# Altium schematic sheet Terminal-Sheet.SchDoc
size 420 x 297 mm; SheetNumber: 5; SheetTotal: 8
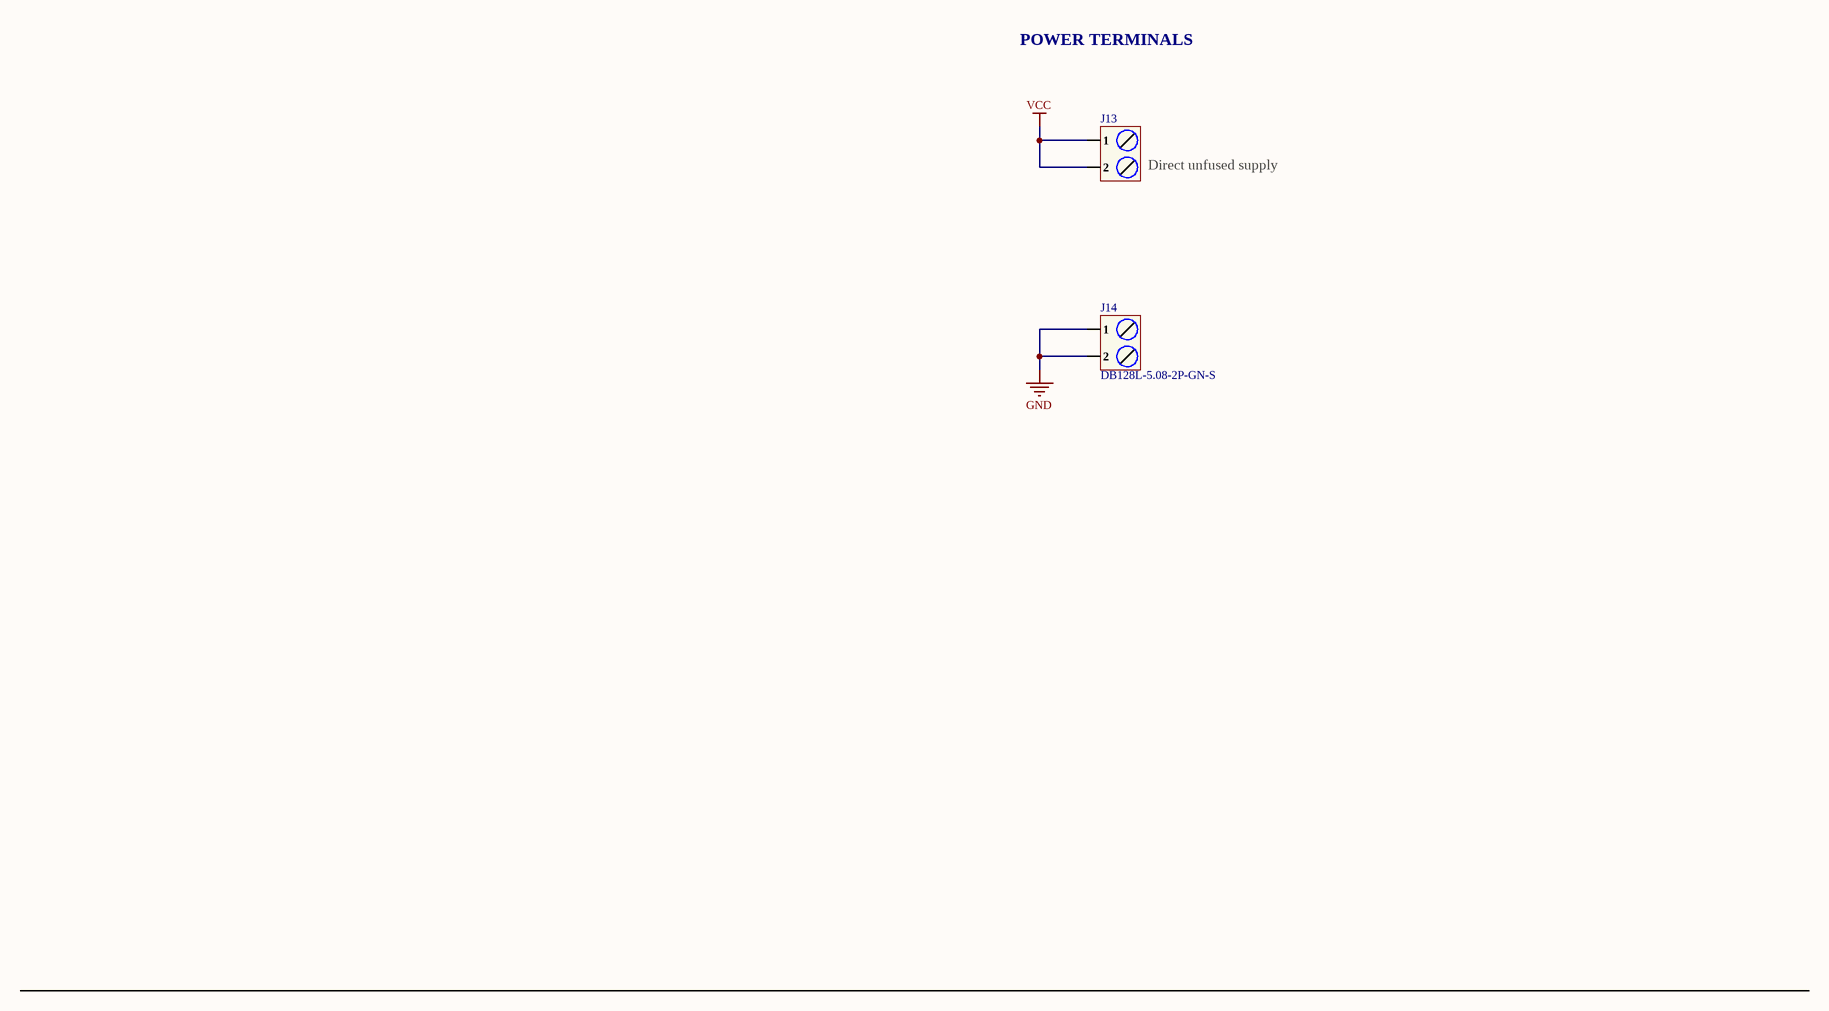
[diagram p0: Terminal-Sheet.SchDoc]

## Parts
J13  DB128L-5.08-2P-GN-S  [DB128L-5.08-2P-GN-S]  (value not drawn)
J14  DB128L-5.08-2P-GN-S  [DB128L-5.08-2P-GN-S]

## Nets
GND: J14.1 J14.2
VCC: J13.1 J13.2

## Notes on the sheet
- POWER TERMINALS
- (near J13) Direct unfused supply
- File:
- Title:
- Date:
- Page
- Num:
- Total:
- Drawn By: Huzaifa Ali

## Library data of the parts
J13 J14 = DB128L-5.08-2P-GN-S: 1x2P 18A -40℃~+105℃ 250V Green 12~30 Straight 5.08mm 2.5 1 2 Plugin,P=5.08mm Screw terminal ROHS; Manufacturer: DORABO; Item Type: Terminal Block; Manufacturer Part Number: DB128L-5.08-2P-GN-S; Package: Plugin,P=5.08mm; LCSC Part Number: C395868; ComponentLink1Description: LCSC; ComponentLink1URL: https://www.lcsc.com/product-detail/Screw-terminal_DORABO-DB128L-5-08-2P-GN-S_C395868.html